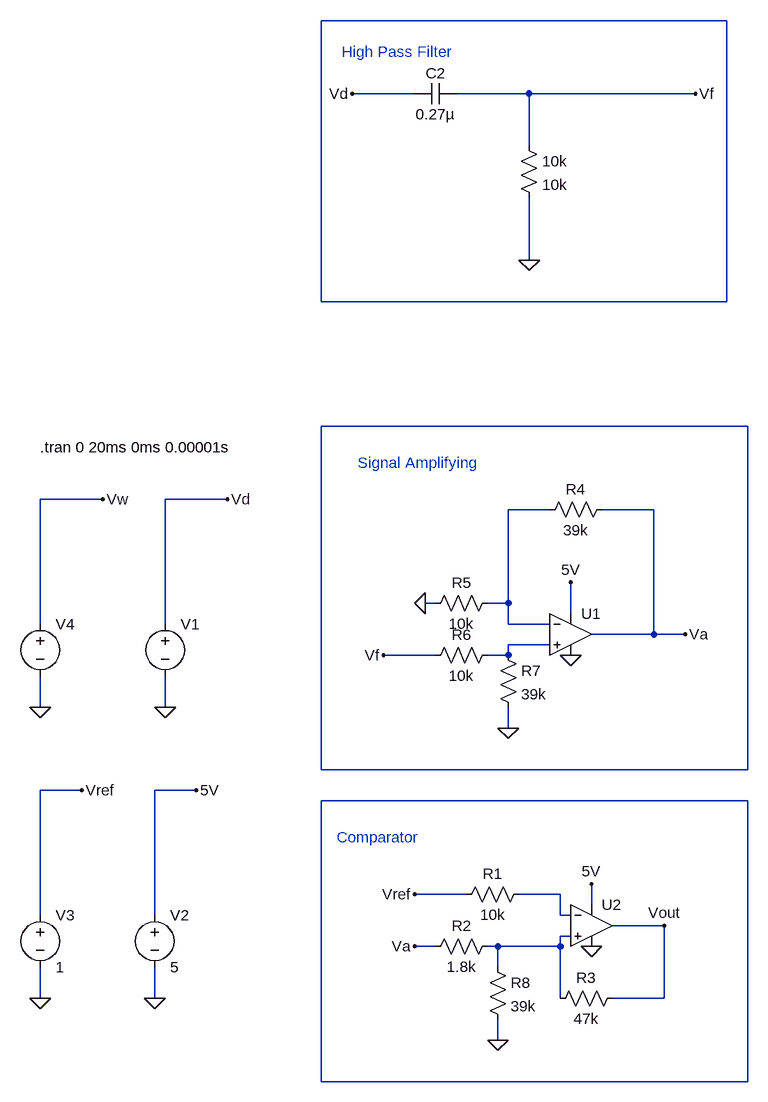
[diagram p0: schematic Analog_cct_concept.asc]
Analog_cct_concept.asc, the LTspice schematic file:
Version 4.1
SHEET 1 880 804
WIRE 400 -864 -224 -864
WIRE -80 -752 -176 -752
WIRE 96 -752 -16 -752
WIRE 352 -752 96 -752
WIRE 96 -672 96 -752
WIRE 96 -496 96 -592
WIRE -224 -432 -224 -864
WIRE 400 -432 400 -864
WIRE 400 -432 -224 -432
WIRE 432 -240 -224 -240
WIRE -560 -128 -656 -128
WIRE -368 -128 -464 -128
WIRE 128 -112 64 -112
WIRE 288 -112 208 -112
WIRE -48 32 -64 32
WIRE 64 32 64 -112
WIRE 64 32 32 32
WIRE 160 48 160 0
WIRE -656 64 -656 -128
WIRE -464 64 -464 -128
WIRE 64 64 64 32
WIRE 128 64 64 64
WIRE 288 80 288 -112
WIRE 288 80 192 80
WIRE 336 80 288 80
WIRE 128 96 64 96
WIRE -48 112 -128 112
WIRE 64 112 64 96
WIRE 64 112 32 112
WIRE -656 192 -656 144
WIRE -464 192 -464 144
WIRE 64 224 64 192
WIRE -224 288 -224 -240
WIRE 432 288 432 -240
WIRE 432 288 -224 288
WIRE -592 320 -656 320
WIRE -416 320 -480 320
WIRE 432 336 -224 336
WIRE 0 480 -80 480
WIRE 144 480 80 480
WIRE 192 496 192 464
WIRE -656 512 -656 320
WIRE -480 512 -480 320
WIRE 144 512 144 480
WIRE 160 512 144 512
WIRE 304 528 224 528
WIRE 160 544 144 544
WIRE -48 560 -80 560
WIRE 48 560 32 560
WIRE 144 560 144 544
WIRE 144 560 48 560
WIRE 48 592 48 560
WIRE -656 640 -656 592
WIRE -480 640 -480 592
WIRE 144 640 144 560
WIRE 304 640 304 528
WIRE 304 640 224 640
WIRE 48 704 48 672
WIRE -224 768 -224 336
WIRE 432 768 432 336
WIRE 432 768 -224 768
FLAG -464 192 0
FLAG -368 -128 Vd
FLAG 160 0 5V
FLAG -480 640 0
FLAG -416 320 5V
FLAG 64 224 0
FLAG 160 112 0
FLAG 336 80 Va
FLAG -80 560 Va
FLAG 192 560 0
FLAG 192 464 5V
FLAG -80 480 Vref
FLAG 304 528 Vout
FLAG -656 640 0
FLAG -592 320 Vref
FLAG -64 32 0
FLAG -128 112 Vf
FLAG 48 704 0
FLAG -656 192 0
FLAG -560 -128 Vw
FLAG 352 -752 Vf
FLAG -176 -752 Vd
FLAG 96 -496 0
SYMBOL voltage -464 48 R0
WINDOW 3 24 96 Invisible 2
WINDOW 123 0 0 Left 0
WINDOW 39 0 0 Left 0
SYMATTR Value PWL file="Y:/Desktop/301/COMPSYS301_team2/csv/LTspice_Files/d_lo_33k - PWL import1.txt"
SYMATTR InstName V1
SYMBOL OpAmps\\UniversalOpAmp2 160 80 R0
SYMATTR InstName U1
SYMBOL voltage -480 496 R0
WINDOW 123 0 0 Left 0
WINDOW 39 0 0 Left 0
SYMATTR InstName V2
SYMATTR Value 5
SYMBOL OpAmps\\UniversalOpAmp2 192 528 R0
SYMATTR InstName U2
SYMBOL res 96 464 R90
WINDOW 0 0 56 VBottom 2
WINDOW 3 32 56 VTop 2
SYMATTR InstName R1
SYMATTR Value 10k
SYMBOL res 48 544 R90
WINDOW 0 0 56 VBottom 2
WINDOW 3 32 56 VTop 2
SYMATTR InstName R2
SYMATTR Value 1.8k
SYMBOL res 240 624 R90
WINDOW 0 0 56 VBottom 2
WINDOW 3 32 56 VTop 2
SYMATTR InstName R3
SYMATTR Value 47k
SYMBOL voltage -656 496 R0
WINDOW 123 0 0 Left 0
WINDOW 39 0 0 Left 0
SYMATTR InstName V3
SYMATTR Value 1
SYMBOL res 224 -128 R90
WINDOW 0 0 56 VBottom 2
WINDOW 3 32 56 VTop 2
SYMATTR InstName R4
SYMATTR Value 39k
SYMBOL res 48 16 R90
WINDOW 0 0 56 VBottom 2
WINDOW 3 32 56 VTop 2
SYMATTR InstName R5
SYMATTR Value 10k
SYMBOL res 48 96 R90
WINDOW 0 0 56 VBottom 2
WINDOW 3 32 56 VTop 2
SYMATTR InstName R6
SYMATTR Value 10k
SYMBOL res 48 96 R0
SYMATTR InstName R7
SYMATTR Value 39k
SYMBOL res 32 576 R0
SYMATTR InstName R8
SYMATTR Value 39k
SYMBOL voltage -656 48 R0
WINDOW 3 24 96 Invisible 2
WINDOW 123 0 0 Left 0
WINDOW 39 0 0 Left 0
SYMATTR Value PWL file="Y:/Desktop/301/COMPSYS301_team2/csv/LTspice_Files/w_lo_33k - import.txt"
SYMATTR InstName V4
SYMBOL cap -16 -768 R90
WINDOW 0 0 32 VBottom 2
WINDOW 3 32 32 VTop 2
SYMATTR InstName C2
SYMATTR Value 0.27µ
SYMBOL res 80 -688 R0
SYMATTR InstName 10k
SYMATTR Value 10k
TEXT -656 -208 Left 2 !.tran 0 20ms 0ms 0.00001s
TEXT -168 -184 Left 2 ;Signal Amplifying
TEXT -200 392 Left 2 ;Comparator
TEXT -192 -816 Left 2 ;High Pass Filter

The netlist it stands for:
* Analog_cct_concept.asc
V1 Vd 0 PWL file="Y:/Desktop/301/COMPSYS301_team2/csv/LTspice_Files/d_lo_33k - PWL import1.txt"
X§U1 N004 N003 5V 0 Va level2 Avol=1Meg GBW=10Meg Slew=10Meg Ilimit=25m Rail=0 Vos=0 En=0 Enk=0 In=0 Ink=0 Rin=500Meg  ; pins In+ In- V+ V- OUT
V2 5V 0 5
X§U2 N007 N006 5V 0 Vout level2 Avol=1Meg GBW=10Meg Slew=10Meg Ilimit=25m Rail=0 Vos=0 En=0 Enk=0 In=0 Ink=0 Rin=500Meg  ; pins In+ In- V+ V- OUT
R1 N006 Vref 10k
R2 N007 Va 1.8k
R3 Vout N007 47k
V3 Vref 0 1
R4 Va N003 39k
R5 N003 0 10k
R6 N004 Vf 10k
R7 N004 0 39k
R8 N007 0 39k
V4 Vw 0 PWL file="Y:/Desktop/301/COMPSYS301_team2/csv/LTspice_Files/w_lo_33k - import.txt"
C2 Vf Vd 0.27µ
R§10k Vf 0 10k
.tran 0 20ms 0ms 0.00001s
* Signal Amplifying
* Comparator
* High Pass Filter
.lib UniversalOpAmp2.lib
.backanno
.end